# Altium schematic sheet Power_Controller-Sheet-ch3.SchDoc (part 1 of 3)
size 420 x 297 mm; SheetNumber: 8; SheetTotal: 10
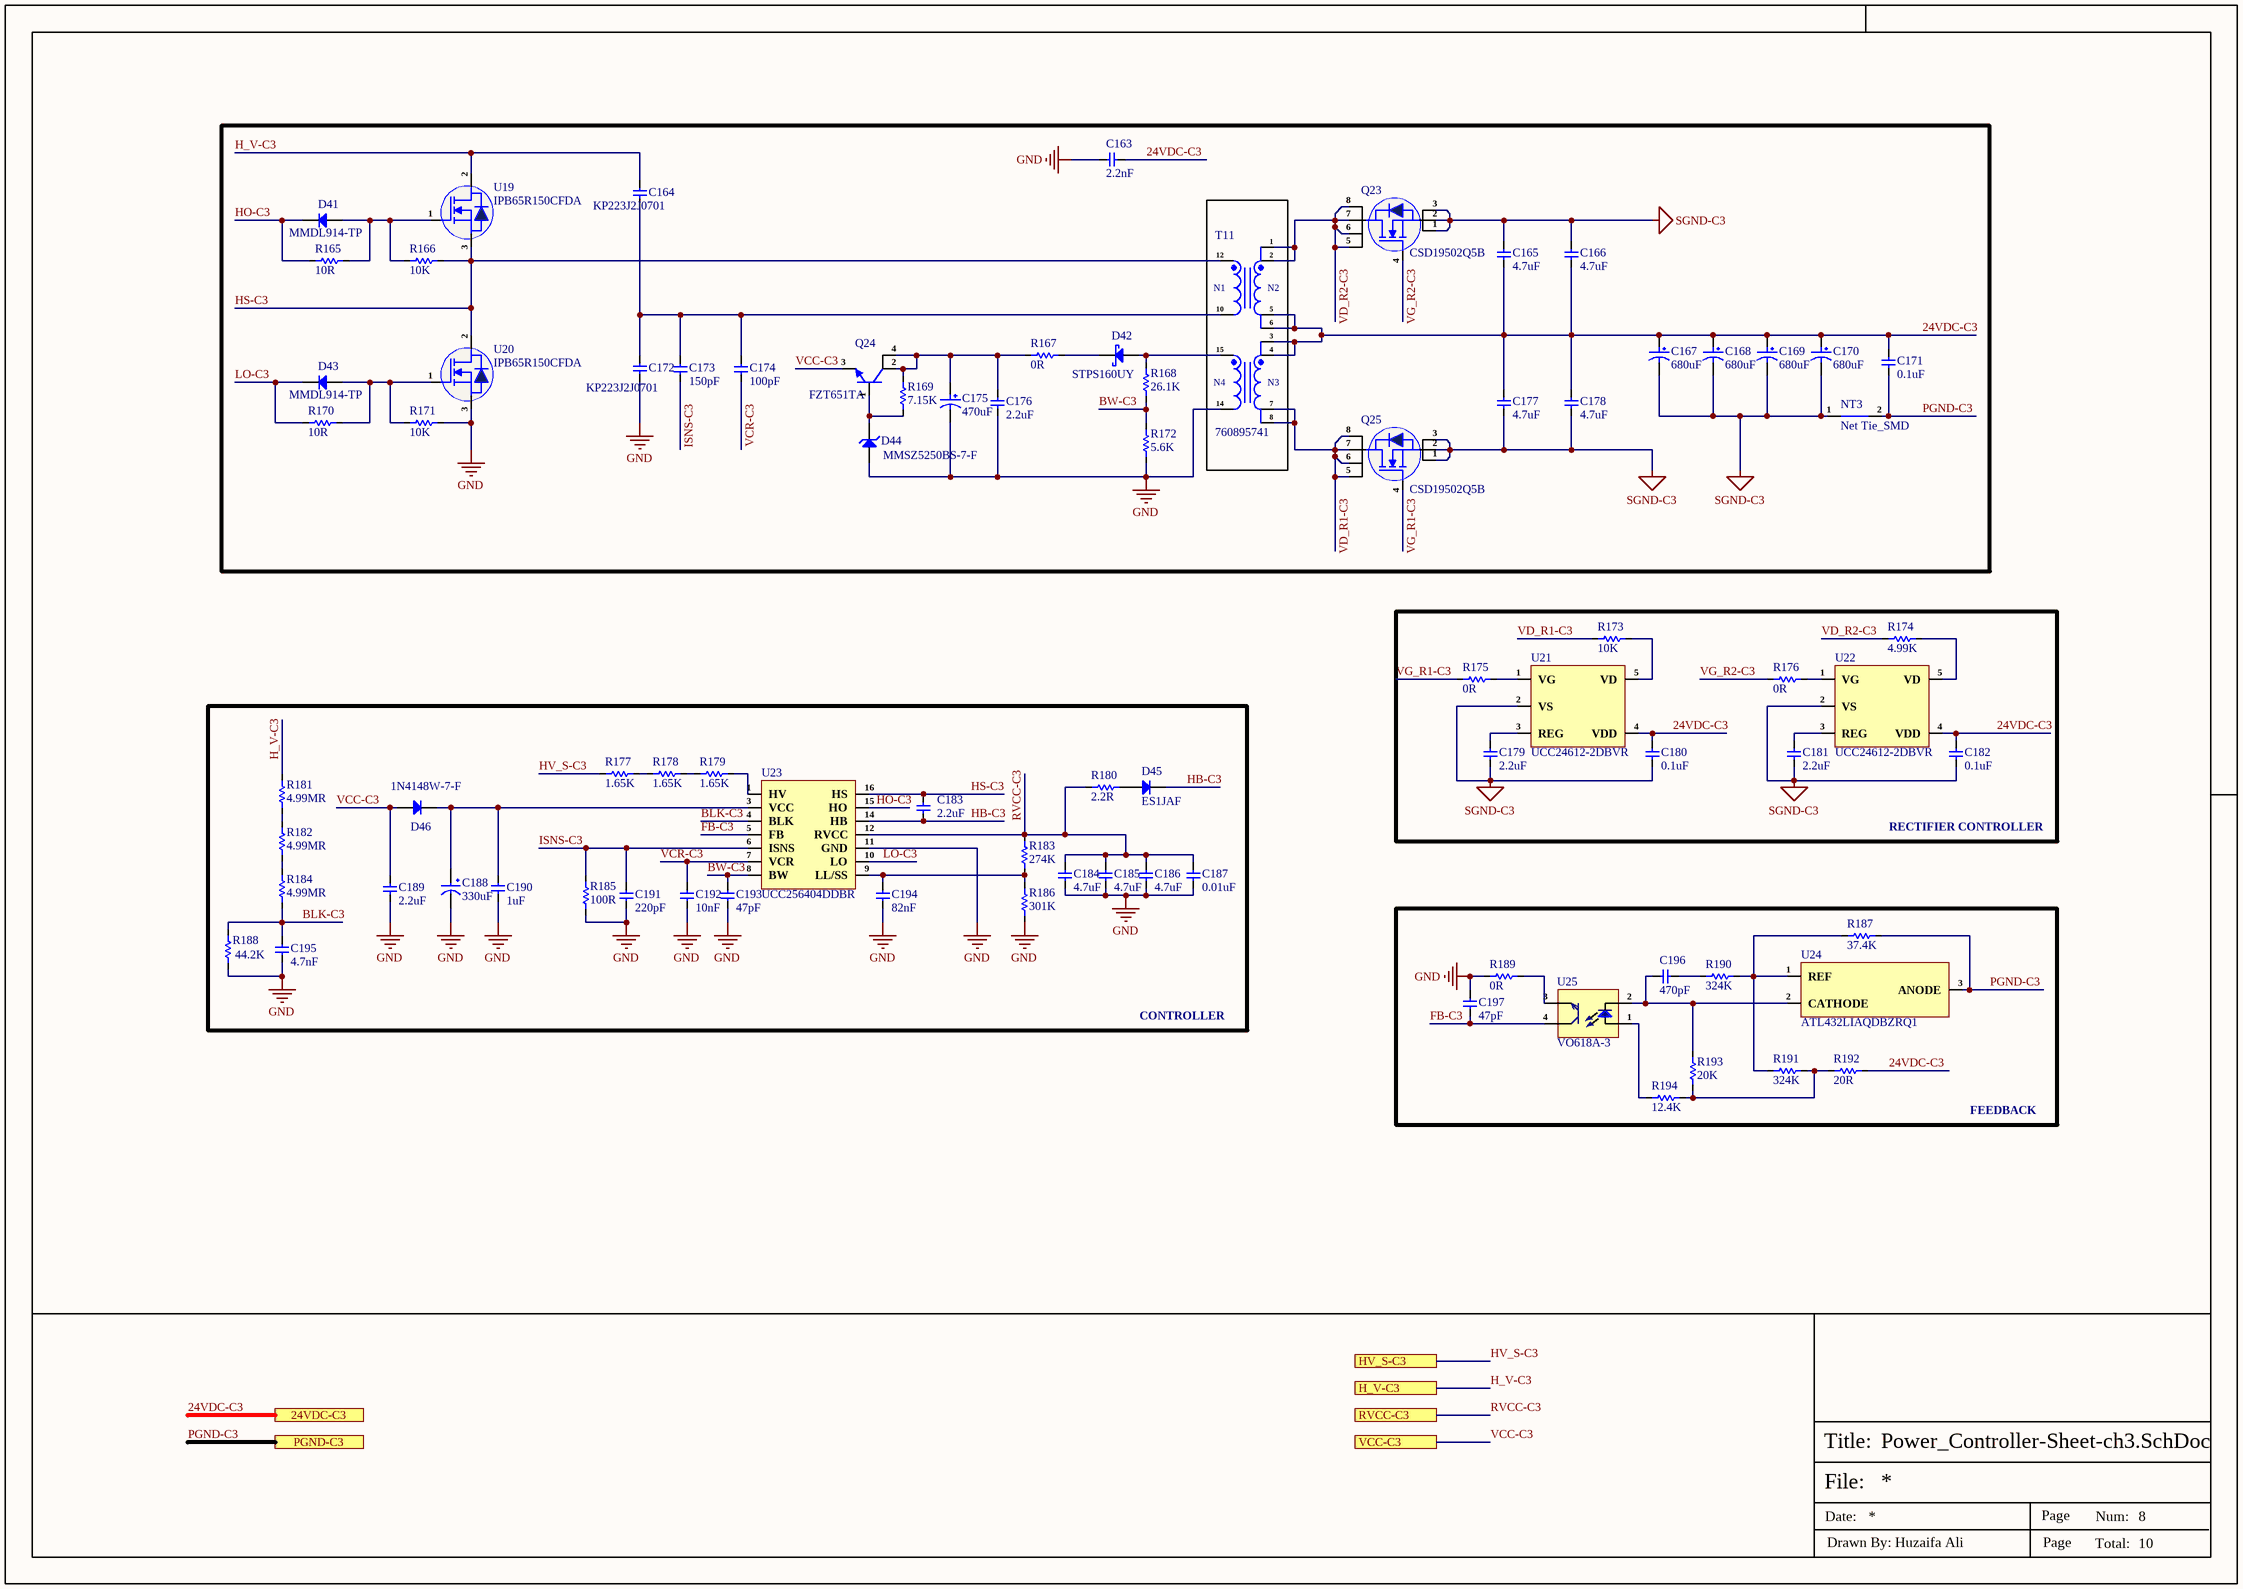
[diagram p0: Power_Controller-Sheet-ch3.SchDoc]

## Parts
C163  2.2nF  [DE1E3RA222MA4BN01F]
C164  KP223J2J0701  [KP223J2J0701]
C165  4.7uF  [Cap-1206]
C166  4.7uF  [Cap-1206]
C167  680uF  [EEU-FR1V681B]
C168  680uF  [EEU-FR1V681B]
C169  680uF  [EEU-FR1V681B]
C170  680uF  [EEU-FR1V681B]
C171  0.1uF  [Cap-1206]
C172  KP223J2J0701  [KP223J2J0701]
C173  150pF  [Cap-1206]
C174  100pF  [Cap-1206]
C175  470uF  [EEUFR1V471B]
C176  2.2uF  [Cap-1206]
C177  4.7uF  [Cap-1206]
C178  4.7uF  [Cap-1206]
C179  2.2uF  [CAP-0603]
C180  0.1uF  [Cap-1206]
C181  2.2uF  [CAP-0603]
C182  0.1uF  [Cap-1206]
C183  2.2uF  [Cap-1206]
C184  4.7uF  [Cap-0603]
C185  4.7uF  [Cap-0603]
C186  4.7uF  [Cap-0603]
C187  0.01uF  [Cap-0603]
C188  330uF  [RC035M331LO8*14TH-2A1E]
C189  2.2uF  [Cap-0603]
C190  1uF  [Cap-1206]
C191  220pF  [Cap-0603]
C192  10nF  [Cap-0603]
C193  47pF  [Cap-0402]
C194  82nF  [Cap-0603]
C195  4.7nF  [Cap-0603]
C196  470pF  [Cap-0603]
C197  47pF  [Cap-0603]
D41  MMDL914-TP  [SOD-323]
D42  STPS160UY  [SMB_]
D43  MMDL914-TP  [SOD-323]
D44  MMSZ5250BS-7-F  [SOD-323]
D45  ES1JAF  [DO-214AD (SMAF)]
D46  1N4148W-7-F  [SOD-123]
NT3  Net Tie_SMD  [Net Tie Pad]  (net tie, no BOM)
Q23  CSD19502Q5B  [VSON-CLIP-8(6x5)]
Q24  FZT651TA  [SOT- 223]
Q25  CSD19502Q5B  [VSON-CLIP-8(6x5)]
R165  10R  [Res-0603]
R166  10K  [RES-0805]
R167  0R  [Res-1206]
R168  26.1K  [Res-0603]
R169  7.15K  [Res-0603]
R170  10R  [Res-0603]
R171  10K  [RES-0805]
R172  5.6K  [RES-0805]
R173  10K  [Res-0603]
R174  4.99K  [Res-0603]
R175  0R  [Res-0402]
R176  0R  [Res-0402]
R177  1.65K  [Res-1206]
R178  1.65K  [Res-1206]
R179  1.65K  [Res-1206]
R180  2.2R  [Res-0603]
R181  4.99MR  [Res-1206]
R182  4.99MR  [Res-1206]
R183  274K  [Res-0603]
R184  4.99MR  [Res-1206]
R185  100R  [Res-0603]
R186  301K  [res-0603]
R187  37.4K  [Res-0603]
R188  44.2K  [Res-0603]
R189  0R  [Res-0603]
R190  324K  [Res-0603]
R191  324K  [Res-0603]
R192  20R  [Res-0603]
R193  20K  [Res-1206]
R194  12.4K  [Res-0603]
T11  760895741  [760895741]
U19  IPB65R150CFDA  [TO-263]
U20  IPB65R150CFDA  [TO-263]
U21  UCC24612-2DBVR  [SOT-23-5]
U22  UCC24612-2DBVR  [SOT-23-5]
U23  UCC256404DDBR  [UCC256404DDBR]
U24  ATL432LIAQDBZRQ1  [SOT-23]
U25  VO618A-3  [DIP-4]

## Blocks framed on the sheet
RECTIFIER CONTROLLER: C179-C182 R173-R176 U21 U22
CONTROLLER: C183-C195 D45 D46 R177-R186 R188 U23
FEEDBACK: C196 C197 R187 R189-R194 U24 U25

## Ports
24VDC-C3 (see Top-Sheet[3B], Connector-Sheet[3D]), H_V-C3 (see Top-Sheet[2B], PFC-Sheet-ch3[1D]), HV_S-C3 (see Top-Sheet[2B], PFC-Sheet-ch3[1D]), PGND-C3 (see Top-Sheet[3B], Connector-Sheet[3D]), RVCC-C3 (see Top-Sheet[2B], PFC-Sheet-ch3[1D]), VCC-C3 (see Top-Sheet[2C], PFC-Sheet-ch3[1D])

## Nets
GND: C163.1 C172.2 C175.2 C176.1 C184.1 C185.1 C186.1 C187.1 C188.2 C189.1 C190.2 C191.1 C192.1 C193.1 C194.1 C195.1 C197.2 D44.2(A) R171.2 R172.1 R185.1 R186.1 R188.1 R189.1 T11.14 U20.3(S) U23.11(GND)
SGND-C3: C165.2 C166.2 C167.2 C168.2 C169.2 C170.2 C177.1 C178.1 C179.1 C180.1 C181.1 C182.1 NT3.1 Q23.1(S) Q23.2(S) Q23.3(S) Q25.1(S) Q25.2(S) Q25.3(S) U21.2(VS) U22.2(VS)
24VDC-C3: C163.2 C165.1 C166.1 C167.1 C168.1 C169.1 C170.1 C171.2 C177.2 C178.2 C180.2 C182.2 R192.2 T11.3 T11.4 T11.5 T11.6 U21.4(VDD) U22.4(VDD) ; port 24VDC-C3
BLK-C3: C195.2 R184.1 R188.2 U23.4(BLK)
BW-C3: C193.2 R168.1 R172.2 U23.8(BW)
FB-C3: C197.1 U23.5(FB) U25.4(C)
H_V-C3: C164.1 R181.2 U19.2(D) ; port H_V-C3
HB-C3: C183.1 D45.1(K) U23.14(HB)
HO-C3: D41.1(K) R165.1 U23.15(HO)
HS-C3: C183.2 R166.2 T11.12 U19.3(S) U20.2(D) U23.16(HS)
HV_S-C3: R177.1 ; port HV_S-C3
ISNS-C3: C173.1 C191.2 R185.2 U23.6(ISNS)
LO-C3: D43.1(K) R170.1 U23.10(LO)
PGND-C3: C171.1 NT3.2 R187.2 U24.3(ANODE) ; port PGND-C3
RVCC-C3: C184.2 C185.2 C186.2 C187.2 R180.1 R183.2 U23.12(RVCC) ; port RVCC-C3
VCC-C3: C189.2 D46.1(A) Q24.3(E) ; port VCC-C3
VCR-C3: C174.1 C192.2 U23.7(VCR)
VD_R1-C3: Q25.5(D) Q25.6(D) Q25.7(D) Q25.8(D) R173.1 T11.7 T11.8
VD_R2-C3: Q23.5(D) Q23.6(D) Q23.7(D) Q23.8(D) R174.1 T11.1 T11.2
VG_R1-C3: Q25.4(G) R175.1
VG_R2-C3: Q23.4(G) R176.1
NetC164_2: C164.2 C172.1 C173.2 C174.2 T11.10
NetC175_1: C175.1 C176.2 Q24.2(C) Q24.4(C) R167.1 R169.2
NetC179_2: C179.2 U21.3(REG)
NetC181_2: C181.2 U22.3(REG)
NetC188_1: C188.1 C190.1 D46.2(K) U23.3(VCC)
NetC194_2: C194.2 R183.1 R186.2 U23.9(LL/SS)
NetC196_1: C196.1 R193.2 U24.2(CATHODE) U25.2(Ca)
NetC196_2: C196.2 R190.1
NetD41_2: D41.2(A) R165.2 R166.1 U19.1(G)
NetD42_1: D42.1(A) R168.2 T11.15
NetD42_2: D42.2(K) R167.2
NetD43_2: D43.2(A) R170.2 R171.1 U20.1(G)
NetD44_1: D44.1(K) Q24.1(B) R169.1
NetD45_2: D45.2(A) R180.2
NetR173_2: R173.2 U21.5(VD)
NetR174_2: R174.2 U22.5(VD)
NetR175_2: R175.2 U21.1(VG)
NetR176_2: R176.2 U22.1(VG)
NetR177_2: R177.2 R178.1
NetR178_2: R178.2 R179.1
NetR179_2: R179.2 U23.1(HV)
NetR181_1: R181.1 R182.2
NetR182_1: R182.1 R184.2
NetR187_1: R187.1 R190.2 R191.1 U24.1(REF)
NetR189_2: R189.2 U25.3(E)
NetR191_2: R191.2 R192.1 R193.1 R194.2
NetR194_1: R194.1 U25.1(An)

## Notes on the sheet
- File:
- Title:
- Date:
- Page
- Num:
- Total:
- Drawn By: Huzaifa Ali
- (in symbol 760895741) N1; N2; N4; N3